# Altium schematic sheet Output-Connection-Sheet.SchDoc
size A4; SheetNumber: 5; SheetTotal: 9
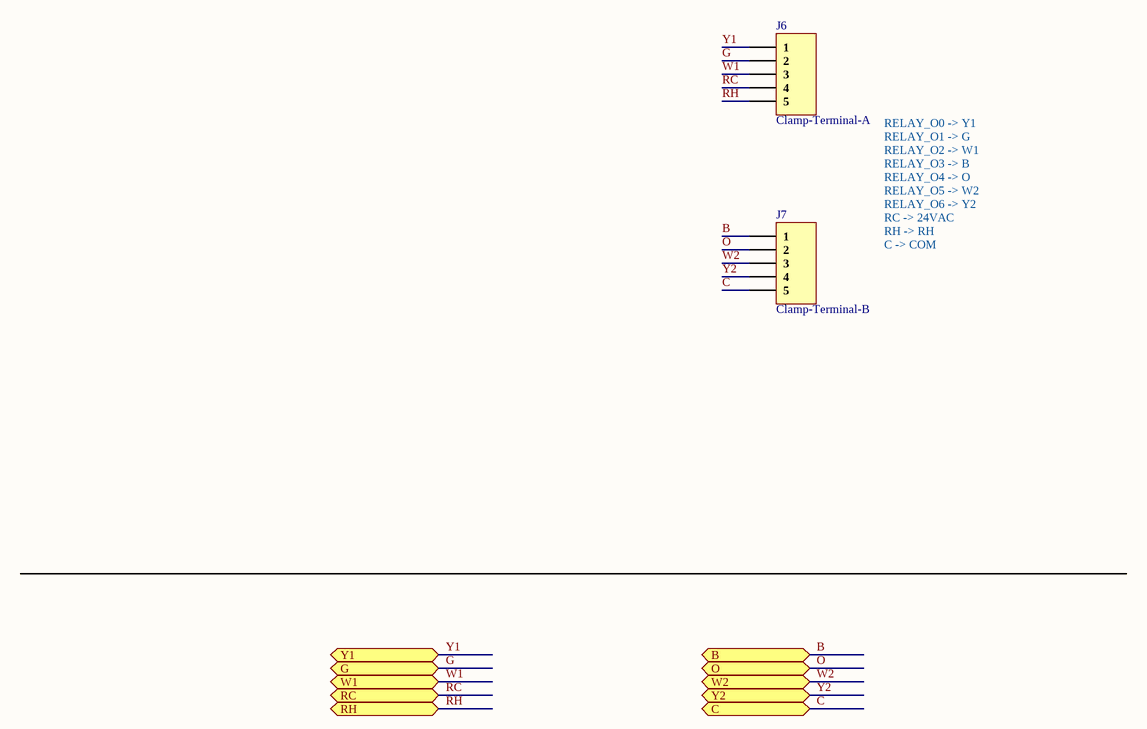
[diagram p0: Output-Connection-Sheet.SchDoc]

## Parts
J6  Clamp-Terminal-A  [Clamp-Terminal-A]
J7  Clamp-Terminal-B  [Clamp-Terminal-B.]

## Ports
B (bidir), C (bidir), G (bidir), O (bidir), RC (bidir), RH (bidir), W1 (bidir), W2 (bidir), Y1 (bidir), Y2 (bidir)

## Nets
B: J7.1 ; port B
C: J7.5 ; port C
G: J6.2 ; port G
O: J7.2 ; port O
RC: J6.4 ; port RC
RH: J6.5 ; port RH
W1: J6.3 ; port W1
W2: J7.3 ; port W2
Y1: J6.1 ; port Y1
Y2: J7.4 ; port Y2

## Notes on the sheet
- RELAY_O0 -> Y1
  RELAY_O1 -> G
  RELAY_O2 -> W1
  RELAY_O3 -> B
  RELAY_O4 -> O
  RELAY_O5 -> W2
  RELAY_O6 -> Y2
  RC -> 24VAC
  RH -> RH
  C -> COM
- File:
- Title:
- Date:
- Page
- Num:
- Total:
- Drawn By: Huzaifa Ali

## Library data of the parts
J6 = Clamp-Terminal-A: PinHeader_1x05_P5.00mm_Vertical
J7 = Clamp-Terminal-B: PinHeader_1x05_P5.00mm_Vertical